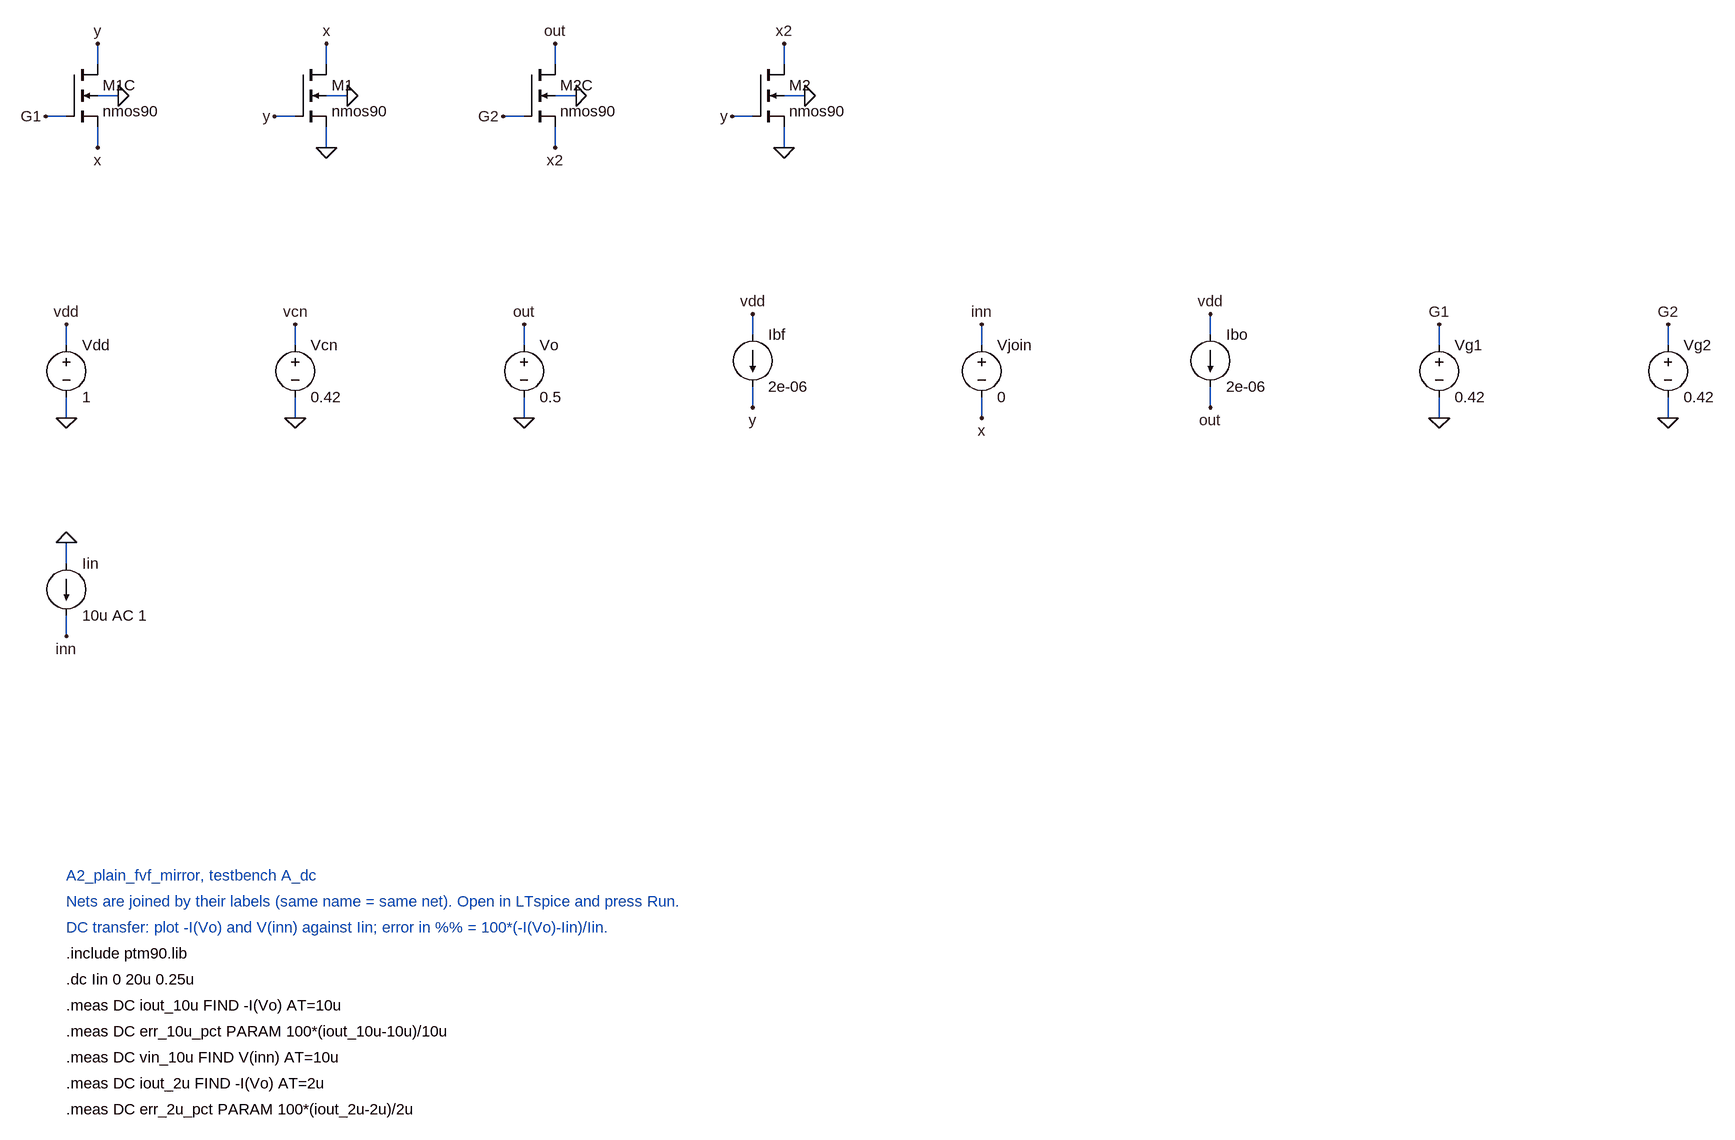
[diagram p0: schematic A2_plain_fvf_mirror_A_dc.asc]
A2_plain_fvf_mirror_A_dc.asc, the LTspice schematic file:
Version 4
SHEET 1 3200 2400
WIRE 48 0 48 -32
WIRE 0 80 -32 80
WIRE 48 96 48 128
WIRE 48 48 80 48
WIRE 400 0 400 -32
WIRE 352 80 320 80
WIRE 400 96 400 128
WIRE 400 48 432 48
WIRE 752 0 752 -32
WIRE 704 80 672 80
WIRE 752 96 752 128
WIRE 752 48 784 48
WIRE 1104 0 1104 -32
WIRE 1056 80 1024 80
WIRE 1104 96 1104 128
WIRE 1104 48 1136 48
WIRE 0 432 0 400
WIRE 0 512 0 544
WIRE 352 432 352 400
WIRE 352 512 352 544
WIRE 704 432 704 400
WIRE 704 512 704 544
WIRE 1056 416 1056 384
WIRE 1056 496 1056 528
WIRE 1408 432 1408 400
WIRE 1408 512 1408 544
WIRE 1760 416 1760 384
WIRE 1760 496 1760 528
WIRE 2112 432 2112 400
WIRE 2112 512 2112 544
WIRE 2464 432 2464 400
WIRE 2464 512 2464 544
WIRE 0 768 0 736
WIRE 0 848 0 880
FLAG 48 -32 y
FLAG -32 80 G1
FLAG 48 128 x
FLAG 80 48 0
FLAG 400 -32 x
FLAG 320 80 y
FLAG 400 128 0
FLAG 432 48 0
FLAG 752 -32 out
FLAG 672 80 G2
FLAG 752 128 x2
FLAG 784 48 0
FLAG 1104 -32 x2
FLAG 1024 80 y
FLAG 1104 128 0
FLAG 1136 48 0
FLAG 0 400 vdd
FLAG 0 544 0
FLAG 352 400 vcn
FLAG 352 544 0
FLAG 704 400 out
FLAG 704 544 0
FLAG 1056 384 vdd
FLAG 1056 528 y
FLAG 1408 400 inn
FLAG 1408 544 x
FLAG 1760 384 vdd
FLAG 1760 528 out
FLAG 2112 400 G1
FLAG 2112 544 0
FLAG 2464 400 G2
FLAG 2464 544 0
FLAG 0 736 0
FLAG 0 880 inn
SYMBOL nmos4 0 0 R0
SYMATTR InstName M1C
SYMATTR Value nmos90
SYMATTR Value2 W=40u L=360n
SYMBOL nmos4 352 0 R0
SYMATTR InstName M1
SYMATTR Value nmos90
SYMATTR Value2 W=10u L=360n
SYMBOL nmos4 704 0 R0
SYMATTR InstName M2C
SYMATTR Value nmos90
SYMATTR Value2 W=40u L=360n
SYMBOL nmos4 1056 0 R0
SYMATTR InstName M2
SYMATTR Value nmos90
SYMATTR Value2 W=10u L=360n
SYMBOL voltage 0 416 R0
SYMATTR InstName Vdd
SYMATTR Value 1
SYMBOL voltage 352 416 R0
SYMATTR InstName Vcn
SYMATTR Value 0.42
SYMBOL voltage 704 416 R0
SYMATTR InstName Vo
SYMATTR Value 0.5
SYMBOL current 1056 416 R0
SYMATTR InstName Ibf
SYMATTR Value 2e-06
SYMBOL voltage 1408 416 R0
SYMATTR InstName Vjoin
SYMATTR Value 0
SYMBOL current 1760 416 R0
SYMATTR InstName Ibo
SYMATTR Value 2e-06
SYMBOL voltage 2112 416 R0
SYMATTR InstName Vg1
SYMATTR Value 0.42
SYMBOL voltage 2464 416 R0
SYMATTR InstName Vg2
SYMATTR Value 0.42
SYMBOL current 0 768 R0
SYMATTR InstName Iin
SYMATTR Value 10u AC 1
TEXT 0 1248 Left 2 ;A2_plain_fvf_mirror, testbench A_dc
TEXT 0 1288 Left 2 ;Nets are joined by their labels (same name = same net). Open in LTspice and press Run.
TEXT 0 1328 Left 2 ;DC transfer: plot -I(Vo) and V(inn) against Iin; error in %% = 100*(-I(Vo)-Iin)/Iin.
TEXT 0 1368 Left 2 !.include ptm90.lib
TEXT 0 1408 Left 2 !.dc Iin 0 20u 0.25u
TEXT 0 1448 Left 2 !.meas DC iout_10u FIND -I(Vo) AT=10u
TEXT 0 1488 Left 2 !.meas DC err_10u_pct PARAM 100*(iout_10u-10u)/10u
TEXT 0 1528 Left 2 !.meas DC vin_10u FIND V(inn) AT=10u
TEXT 0 1568 Left 2 !.meas DC iout_2u FIND -I(Vo) AT=2u
TEXT 0 1608 Left 2 !.meas DC err_2u_pct PARAM 100*(iout_2u-2u)/2u

The netlist it stands for:
* A2_plain_fvf_mirror_A_dc.asc
M1C y G1 x 0 nmos90 W=40u L=360n
M1 x y 0 0 nmos90 W=10u L=360n
M2C out G2 x2 0 nmos90 W=40u L=360n
M2 x2 y 0 0 nmos90 W=10u L=360n
Vdd vdd 0 1
Vcn vcn 0 0.42
Vo out 0 0.5
Ibf vdd y 2e-06
Vjoin inn x 0
Ibo vdd out 2e-06
Vg1 G1 0 0.42
Vg2 G2 0 0.42
Iin 0 inn 10u AC 1
.model NMOS NMOS
.model PMOS PMOS
.lib standard.mos
* A2_plain_fvf_mirror, testbench A_dc
* Nets are joined by their labels (same name = same net). Open in LTspice and press Run.
* DC transfer: plot -I(Vo) and V(inn) against Iin; error in %% = 100*(-I(Vo)-Iin)/Iin.
.include ptm90.lib
.dc Iin 0 20u 0.25u
.meas DC iout_10u FIND -I(Vo) AT=10u
.meas DC err_10u_pct PARAM 100*(iout_10u-10u)/10u
.meas DC vin_10u FIND V(inn) AT=10u
.meas DC iout_2u FIND -I(Vo) AT=2u
.meas DC err_2u_pct PARAM 100*(iout_2u-2u)/2u
.backanno
.end